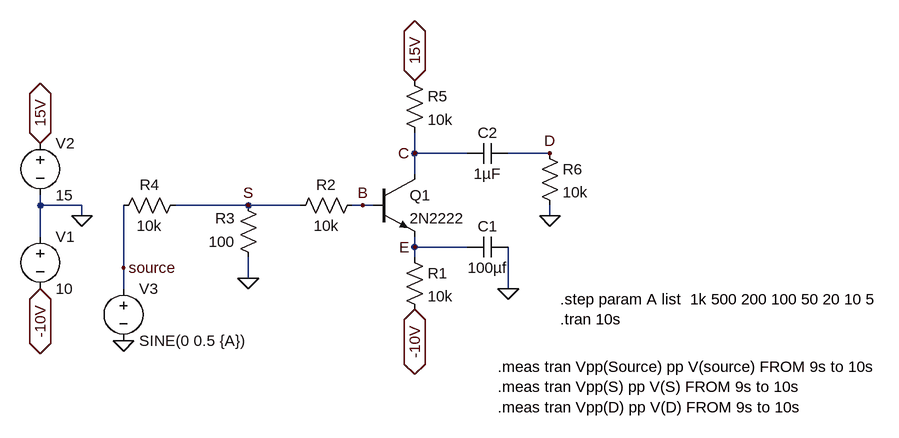
[diagram p0: schematic circuit1-2.asc]
circuit1-2.asc, the LTspice schematic file:
Version 4
SHEET 1 1144 680
WIRE 384 192 384 160
WIRE 464 192 384 192
WIRE 592 192 528 192
WIRE 384 224 384 192
WIRE -192 272 -192 256
WIRE -128 272 -192 272
WIRE 128 272 16 272
WIRE 208 272 128 272
WIRE 304 272 288 272
WIRE 320 272 304 272
WIRE -128 288 -128 272
WIRE 592 288 592 272
WIRE -192 320 -192 272
WIRE 384 336 384 320
WIRE 464 336 384 336
WIRE 384 352 384 336
WIRE -64 368 -64 272
WIRE 128 384 128 352
WIRE -64 400 -64 368
WIRE 528 400 528 336
FLAG -128 288 0
FLAG 128 384 0
FLAG 528 400 0
FLAG 592 288 0
FLAG -192 400 -10V
IOPIN -192 400 BiDir
FLAG 384 432 -10V
IOPIN 384 432 BiDir
FLAG -192 176 15V
IOPIN -192 176 BiDir
FLAG 384 80 15V
IOPIN 384 80 BiDir
FLAG -64 480 0
FLAG 128 272 S
FLAG 384 192 C
FLAG 592 192 D
FLAG 384 336 E
FLAG 304 272 B
FLAG -64 368 source
SYMBOL npn 320 224 R0
SYMATTR InstName Q1
SYMATTR Value 2N2222
SYMBOL Res 368 336 R0
SYMATTR InstName R1
SYMATTR Value 10k
SYMBOL Res 304 256 R90
WINDOW 0 0 56 VBottom 2
WINDOW 3 32 56 VTop 2
SYMATTR InstName R2
SYMATTR Value 10k
SYMBOL Res 144 368 R180
WINDOW 0 36 76 Left 2
WINDOW 3 36 40 Left 2
SYMATTR InstName R3
SYMATTR Value 100
SYMBOL Res -80 288 R270
WINDOW 0 32 56 VTop 2
WINDOW 3 0 56 VBottom 2
SYMATTR InstName R4
SYMATTR Value 10k
SYMBOL Res 368 64 R0
SYMATTR InstName R5
SYMATTR Value 10k
SYMBOL Res 576 176 R0
SYMATTR InstName R6
SYMATTR Value 10k
SYMBOL Voltage -192 304 R0
SYMATTR InstName V1
SYMATTR Value 10
SYMBOL Cap 528 320 R90
WINDOW 0 0 32 VBottom 2
WINDOW 3 32 32 VTop 2
SYMATTR InstName C1
SYMATTR Value 100µf
SYMBOL Cap 528 176 R90
WINDOW 0 0 32 VBottom 2
WINDOW 3 32 32 VTop 2
SYMATTR InstName C2
SYMATTR Value 1µF
SYMBOL Voltage -192 160 R0
SYMATTR InstName V2
SYMATTR Value 15
SYMBOL Voltage -64 384 R0
SYMATTR InstName V3
SYMATTR Value SINE(0 0.5 {A})
TEXT 512 520 Left 2 !.meas tran Vpp(Source) pp V(source) FROM 9s to 10s\n.meas tran Vpp(S) pp V(S) FROM 9s to 10s  \n.meas tran Vpp(D) pp V(D) FROM 9s to 10s
TEXT 608 416 Left 2 !.step param A list  1k 500 200 100 50 20 10 5\n.tran 10s

The netlist it stands for:
* circuit1-2.asc
Q1 C B E 0 2N2222
R1 E -10V 10k
R2 B S 10k
R3 0 S 100
R4 source S 10k
R5 15V C 10k
R6 D 0 10k
V1 0 -10V 10
C1 0 E 100µf
C2 D C 1µF
V2 15V 0 15
V3 source 0 SINE(0 0.5 {A})
.model NPN NPN
.model PNP PNP
.lib standard.bjt
.meas tran Vpp(Source) pp V(source) FROM 9s to 10s
.meas tran Vpp(S) pp V(S) FROM 9s to 10s
.meas tran Vpp(D) pp V(D) FROM 9s to 10s
.step param A list  1k 500 200 100 50 20 10 5
.tran 10s
.backanno
.end